# Altium schematic sheet pca20072_rffe.SchDoc: nRF54L15 Tag - RFFE
size A4; Organization: Nordic Semiconductor; DocumentNumber: 3; SheetNumber: 3; SheetTotal: 5; CompanyName: Nordic Semiconductor; DocumentSize: A4
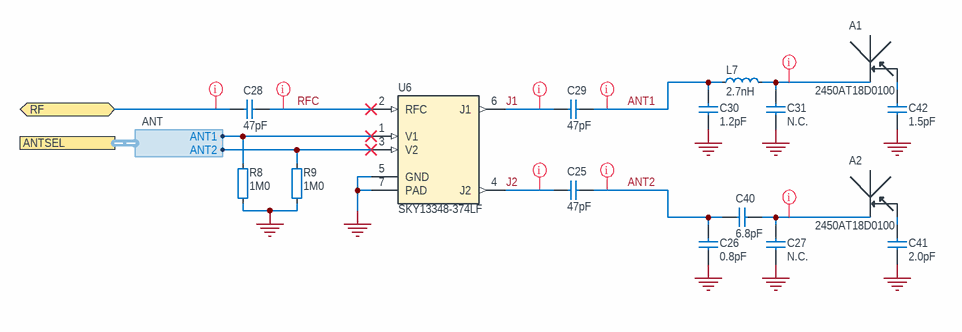
[diagram p0: pca20072_rffe.SchDoc]

## Parts
A1  2450AT18D0100  [2450AT18D0100_TE-R]
A2  2450AT18D0100  [2450AT18D0100_TE-L]
C25  47pF  [CAPC0603X03L_C]
C26  0.8pF  [CAPC1005X04L_C2]
C27  N.C.  [CAPC1005X04L_C2]
C28  47pF  [CAPC0603X03L_C]
C29  47pF  [CAPC0603X03L_C]
C30  1.2pF  [CAPC1005X04L_C2]
C31  N.C.  [CAPC1005X04L_C2]
C40  6.8pF  [CAPC1005X04L_C2]
C41  2.0pF  [CAPC1005X04L_C2]
C42  1.5pF  [CAPC1005X04L_C2]
L7  2.7nH  [INDC1005X04L_C2]
R8  1M0  [RESC0603X03L_C]
R9  1M0  [RESC0603X03L_C]
U6  SKY13348-374LF  [SON50P150X50_HS-7N]

## Ports
ANTSEL (harness ANT), RF (bidir)

## Harnesses
ANT: ANT2, ANT1

## Nets
GND: A1.2(GND) A2.2(GND) C26.1 C27.1 C30.1 C31.1 C41.1 C42.1 R8.1 R9.1 U6.5(GND) U6.7(PAD)
ANT1: C29.1 C30.2 L7.1
ANT2: C25.1 C26.2 C40.1
J1: C29.2 U6.6(J1)
J2: C25.2 U6.4(J2)
RF: C28.2 ; port RF
RFC: C28.1 U6.2(RFC)
NetA1_1: A1.1 C31.2 L7.2
NetA1_3: A1.3(Tuning) C42.2
NetA2_1: A2.1 C27.2 C40.2
NetA2_3: A2.3(Tuning) C41.2
NetR8_2: R8.2 U6.1(V1) ; port ANTSEL.ANT1
NetR9_2: R9.2 U6.3(V2) ; port ANTSEL.ANT2

## Layout directives
net class RF: ANT1, ANT2, J1, J2, NetA1_1, NetA2_1, RF, RFC

## Notes on the sheet
- Title
- Size
- Date:
- File:
- A4
- PCB Assembly Number
- Sheet
- Drawn By:
- Revision
- of
- Classification:

## Library data of the parts
A1 A2 = Johanson 2450AT18D0100_TE: 2.45 GHz chip antenna; Manufacturer: Johanson Technology; Part number IPS: 00000001415; Part number NEMS: 100700004, 100700005, 100700006; Component Status: Active; Pad Count: 4; Note: N.A.; Artikkelnr Noca: 53059035; Part Number: Johanson 2450AT18D0100_TE; PartId: 100700006; Component Class: Antennas; Author: rsk; Manufacturer Part Number: 2450AT18D0100; ComponentLink1URL: N.A.; ComponentLink1Description: Datasheet; ComponentLink2URL: N.A.; ComponentLink2Description: Supplier link; HelpURL: http://www.johansontechnology.com/datasheets/antennas/2450AT18D0100.pdf; LatestRevisionDate: 2025-01-07; Published: 2016-01-12; Footprint Doc: 2450AT18D0100; Value: 2450AT18D0100; Supplier 1: DigiKey; Supplier Part Number 1: 2450AT18D0100E; Supplier 2: Mouser; Supplier Part Number 2: 609-2450AT18D0100E; Part number Norautron: N.A.
C25 C28 C29 = C0201-47p-25V-NP0-QLCD250Q470G1GV001T: Capacitor, High Q, Low Loss, C0G/NP0, 25V, ±2%, -55°C ~ 125°C; Manufacturer: Johanson Technology; Part number IPS: 00000010810; Component Status: Active; Pad Count: 2; Artikkelnr Noca: N.A.; Part Number: C0201-47p-25V-NP0-QLCD250Q470G1GV001T; Component Class: Capacitors; Author: rubr; Manufacturer Part Number: QLCD250Q470G1GV001T; ComponentLink1URL: https://www.johansontechnology.com/search/pn-pdf/QLCD250Q470G1GV001T/; ComponentLink1Description: Datasheet; ComponentLink2URL: https://www.digikey.com/en/products/detail/johanson-technology-inc/QLCD250Q470G1GV001T/1561502; ComponentLink2Description: Supplier link; HelpURL: https://www.johansontechnology.com/products/rf-capacitors/high-q-multilayer-capacitors/0201-lseries/; LatestRevisionDate: 2026-04-13; Published: 2026-04-13; Footprint Doc: 0201; Value: 47pF; Note: 25V; Supplier 1: DigiKey; Supplier Part Number 1: 712-QLCD250Q470G1GV001TCT-ND; Supplier 2: N.A.; Supplier Part Number 2: N.A.; Part number Norautron: N.A.
C26 = C0402-0.8p: Capacitor, NP0, ±5%; Manufacturer: Murata; Manufacturer Part Number: GRM1555C1HR80WA01D; Part number IPS: 00000007782; Part number Norautron: N.A.; Part number NEMS: 100200116; Component Status: Active; Pad Count: 2; Note: 50V; Artikkelnr Noca: 20029147; Part Number: C0402-0.8p; PartId: 100200116; Component Class: Capacitors; Author: rsk; ComponentLink1URL: https://www.murata.com/~/media/webrenewal/support/library/catalog/products/capacitor/mlcc/c02e.ashx?la=en-us; ComponentLink1Description: Datasheet; ComponentLink2URL: N.A.; ComponentLink2Description: Supplier link; HelpURL: N.A.; LatestRevisionDate: 2012-11-21; Published: 2009-05-08; Footprint Doc: 0402; Value: 0.8pF; Supplier 1: DigiKey; Supplier Part Number 1: 490-6270-1-ND; Supplier 2: N.A.; Supplier Part Number 2: N.A.
C27 C31 = C0402-N.C.: Not mounted; Manufacturer: N.A.; Part number NEMS: 100200105; Component Status: Active; Pad Count: 2; Note: Chip Cap; Assembly: Not mounted; Part Number: C0402-N.C.; PartId: 100200105; Component Class: Capacitors; Author: rsk; Manufacturer Part Number: N.A.; ComponentLink1URL: N.A.; ComponentLink1Description: Datasheet; ComponentLink2URL: N.A.; ComponentLink2Description: Supplier link; HelpURL: N.A.; LatestRevisionDate: 2009-05-08; Published: 2009-05-08; Footprint Doc: 0402; Value: N.C.; Supplier 1: N.A.; Supplier Part Number 1: N.A.; Supplier 2: N.A.; Supplier Part Number 2: N.A.; Artikkelnr Noca: N.A.; Part number IPS: N.A.; Part number Norautron: N.A.
C30 = C0402-1.2p: Capacitor, NP0, ±0.1pF; Manufacturer: N.A.; Part number IPS: 00000005410; Part number NEMS: 100200119; Component Status: Active; Pad Count: 2; Note: 50V; Artikkelnr Noca: 20029157; Part Number: C0402-1.2p; PartId: 100200119; Component Class: Capacitors; Author: rsk; Manufacturer Part Number: N.A.; ComponentLink1URL: N.A.; ComponentLink1Description: Datasheet; ComponentLink2URL: N.A.; ComponentLink2Description: Supplier link; HelpURL: N.A.; LatestRevisionDate: 2011-05-11; Published: 2009-05-08; Footprint Doc: 0402; Value: 1.2pF; Supplier 1: N.A.; Supplier Part Number 1: N.A.; Supplier 2: N.A.; Supplier Part Number 2: N.A.; Part number Norautron: N.A.
C40 = C0402-6.8p-50V-NP0-GJM1555C1H6R8BB01D: Capacitor, High Q, Low Loss, C0G/NP0, 50V, ±0.1pF, -55°C ~ 125°C; Manufacturer: Murata; Part number IPS: 80000004966; Component Status: Active; Pad Count: 2; Artikkelnr Noca: N.A.; Part Number: C0402-6.8p-50V-NP0-GJM1555C1H6R8BB01D; Component Class: Capacitors; Author: rubr; Manufacturer Part Number: GJM1555C1H6R8BB01D; ComponentLink1URL: https://search.murata.co.jp/Ceramy/image/img/A01X/G101/ENG/GJM1555C1H6R8BB01-01.pdf; ComponentLink1Description: Datasheet; ComponentLink2URL: https://www.digikey.com/en/products/detail/murata-electronics/GJM1555C1H6R8BB01D/2593097; ComponentLink2Description: Supplier link; HelpURL: https://pim.murata.com/en-global/pim/details/?partNum=GJM1555C1H6R8BB01%23; LatestRevisionDate: 2026-04-13; Published: 2026-04-13; Footprint Doc: 0402; Value: 6.8pF; Note: 50V; Supplier 1: DigiKey; Supplier Part Number 1: 490-12599-1-ND; Supplier 2: N.A.; Supplier Part Number 2: N.A.; Part number Norautron: N.A.
C41 = C0402-2.0p-50V-NP0-GJM1555C1H2R0BB01: Capacitor, High Q, Low Loss, C0G/NP0, 50V, ±0.1pF, -55°C ~ 125°C; Manufacturer: Murata; Part number IPS: 80000004957; Part number NEMS: 100200697; Component Status: Active; Pad Count: 2; Artikkelnr Noca: N.A.; Part Number: C0402-2.0p-50V-NP0-GJM1555C1H2R0BB01; Component Class: Capacitors; Author: rubr; Manufacturer Part Number: GJM1555C1H2R0BB01; ComponentLink1URL: https://search.murata.co.jp/Ceramy/image/img/A01X/G101/ENG/GJM1555C1H2R0BB01-01.pdf; ComponentLink1Description: Datasheet; ComponentLink2URL: https://www.digikey.com/en/products/detail/murata-electronics/GJM1555C1H2R0BB01D/2592912; ComponentLink2Description: Supplier link; HelpURL: https://pim.murata.com/en-global/pim/details/?partNum=GJM1555C1H2R0BB01%23; LatestRevisionDate: 2026-04-13; Published: 2025-04-23; Footprint Doc: 0402; Value: 2.0pF; Note: 50V; Supplier 1: DigiKey; Supplier Part Number 1: 490-8091-1-ND; Supplier 2: N.A.; Supplier Part Number 2: N.A.; Part number Norautron: N.A.; PartId: 100200697
C42 = C0402-1.5p-50V-NP0-GJM1555C1H1R5BB01D: Capacitor, High Q, Low Loss, C0G/NP0, 50V, ±0.1pF, -55°C ~ 125°C; Manufacturer: Murata; Part number IPS: 80000004967; Component Status: Active; Pad Count: 2; Artikkelnr Noca: N.A.; Part Number: C0402-1.5p-50V-NP0-GJM1555C1H1R5BB01D; Component Class: Capacitors; Author: rubr; Manufacturer Part Number: GJM1555C1H1R5BB01D; ComponentLink1URL: https://search.murata.co.jp/Ceramy/image/img/A01X/G101/ENG/GJM1555C1H1R5BB01-01.pdf; ComponentLink1Description: Datasheet; ComponentLink2URL: https://www.digikey.com/en/products/detail/murata-electronics/GJM1555C1H1R5BB01D/2592887; ComponentLink2Description: Supplier link; HelpURL: https://pim.murata.com/en-global/pim/details/?partNum=GJM1555C1H1R5BB01%23; LatestRevisionDate: 2026-04-13; Published: 2026-04-13; Footprint Doc: 0402; Value: 1.5pF; Note: 50V; Supplier 1: DigiKey; Supplier Part Number 1: 490-8087-1-ND; Supplier 2: N.A.; Supplier Part Number 2: N.A.; Part number Norautron: N.A.
L7 = L0402-2n7-Multilayer_Murata: Inductor, 800mA, ±2%, 120mΩ; Manufacturer: Murata; Manufacturer Part Number: LQG15HS2N7B02D; Part number NEMS: 100300445; Component Status: Active; Pad Count: 2; Note: -55°C ~ 125°C; Artikkelnr Noca: N.A.; Part Number: L0402-2n7-Multilayer_Murata; PartId: 100300445; Component Class: Inductors; Author: hany; ComponentLink1URL: https://search.murata.co.jp/Ceramy/image/img/P02/JELF243B-0010.pdf; ComponentLink1Description: Datasheet; ComponentLink2URL: N.A.; ComponentLink2Description: Supplier link; HelpURL: https://search.murata.co.jp/Ceramy/image/img/P02/JELF243B-0010.pdf; LatestRevisionDate: 2023-06-06; Published: 2023-06-06; Footprint Doc: 0402; Value: 2.7nH; Supplier 1: DigiKey; Supplier Part Number 1: 490-LQG15HS2N7B02DTR-ND; Supplier 2: Mouser; Supplier Part Number 2: 81-LQG15HS2N7B02D; Part number IPS: N.A.; Part number Norautron: N.A.
R8 R9 = R0201-1M0: Resistor, ±1%, 0.05W; Manufacturer: N.A.; Part number IPS: 00000001418; Part number Norautron: 26107108; Part number NEMS: 100100093; Component Status: Active; Pad Count: 2; Note: Chip Res 1%; Part Number: R0201-1M0; PartId: 100100093; Component Class: Resistors; Author: rsk; Manufacturer Part Number: N.A.; ComponentLink1URL: N.A.; ComponentLink1Description: Datasheet; ComponentLink2URL: N.A.; ComponentLink2Description: Supplier link; HelpURL: N.A.; LatestRevisionDate: 2014-11-13; Published: 2014-11-13; Footprint Doc: 0201; Value: 1M0; Supplier 1: N.A.; Supplier Part Number 1: N.A.; Supplier 2: N.A.; Supplier Part Number 2: N.A.; Artikkelnr Noca: N.A.
U6 = SKY13348-374LF: 50 MHz-6.0 GHz GaAs SPDT Switch; Manufacturer: Skyworks; Part number NEMS: 101900872; Component Status: Active; Pad Count: 6; Note: N.A.; Part Number: SKY13348-374LF; PartId: 101900872; Component Class: Misc_ICs; Author: rubr; Manufacturer Part Number: SKY13348-374LF; ComponentLink1URL: https://www.skyworksinc.com/-/media/E9327268CB16479EBC64472424698E70.pdf; ComponentLink1Description: Datasheet; ComponentLink2URL: https://www.digikey.com/en/products/detail/skyworks-solutions-inc/SKY13348-374LF/2658308; ComponentLink2Description: Supplier link; HelpURL: https://www.skyworksinc.com/Products/Switches/SKY13348-374LF; LatestRevisionDate: 2025-04-09; Published: 2025-04-09; Footprint Doc: XFDFN-6; Value: SKY13348-374LF; Supplier 1: DigiKey; Supplier Part Number 1: 863-1335-1-ND; Supplier 2: N.A.; Supplier Part Number 2: N.A.; Artikkelnr Noca: N.A.; Part number IPS: N.A.; Part number Norautron: N.A.